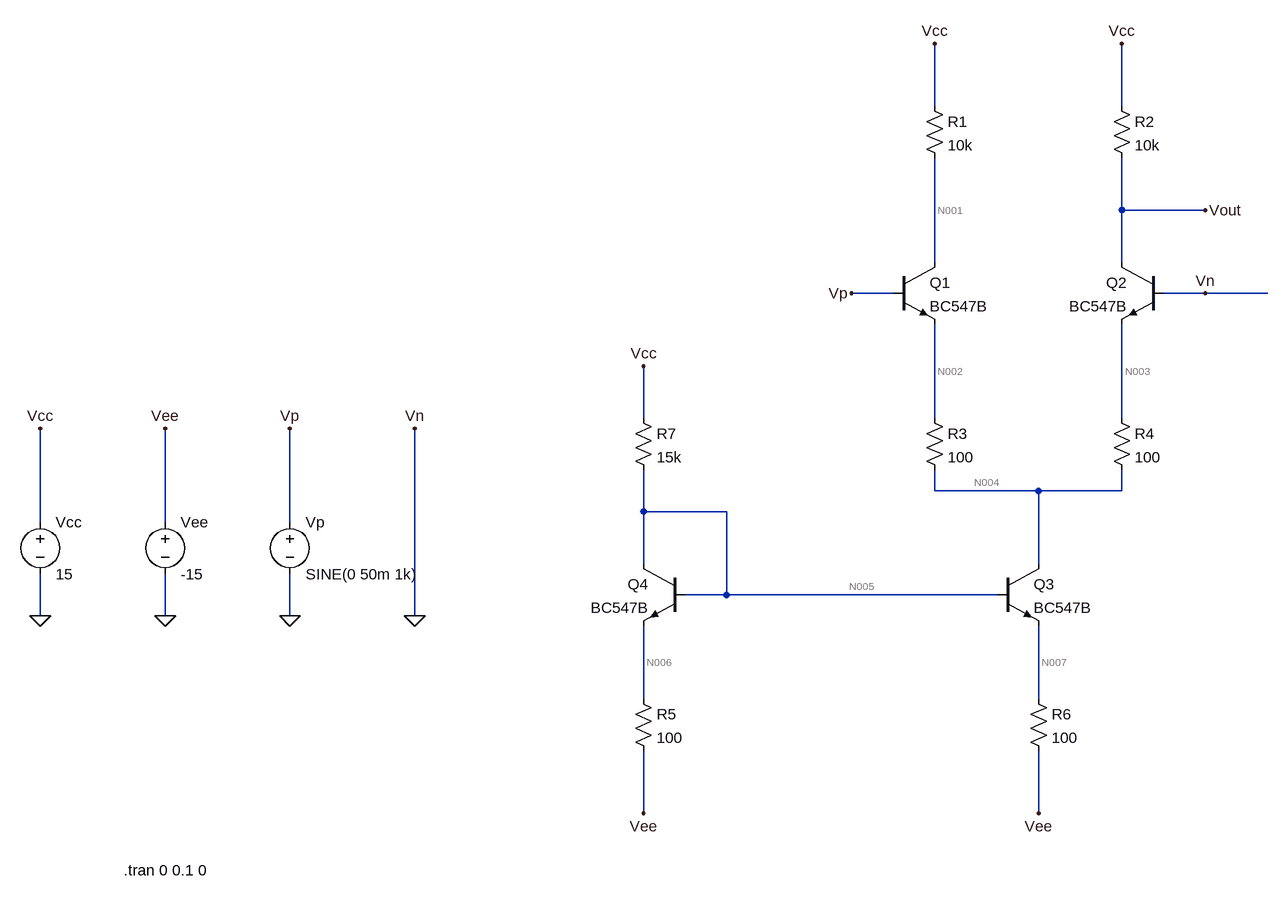
[diagram p0: schematic Draft3.asc]
Draft3.asc, the LTspice schematic file:
Version 4
SHEET 1 880 1244
WIRE 96 48 96 -48
WIRE 384 48 384 -48
WIRE 384 208 384 128
WIRE 512 208 384 208
WIRE 96 288 96 128
WIRE 384 288 384 208
WIRE 32 336 -32 336
WIRE 512 336 448 336
WIRE 608 336 512 336
WIRE -352 528 -352 448
WIRE 96 528 96 384
WIRE 384 528 384 384
WIRE 96 640 96 608
WIRE 256 640 96 640
WIRE 384 640 384 608
WIRE 384 640 256 640
WIRE -352 672 -352 608
WIRE -224 672 -352 672
WIRE -1280 688 -1280 544
WIRE -1088 688 -1088 544
WIRE -896 688 -896 544
WIRE -352 752 -352 672
WIRE 256 752 256 640
WIRE -224 800 -224 672
WIRE -224 800 -288 800
WIRE 192 800 -224 800
WIRE -1280 832 -1280 768
WIRE -1088 832 -1088 768
WIRE -896 832 -896 768
WIRE -704 832 -704 544
WIRE -352 960 -352 848
WIRE 256 960 256 848
WIRE -352 1136 -352 1040
WIRE 256 1136 256 1040
FLAG -352 448 Vcc
FLAG 96 -48 Vcc
FLAG 384 -48 Vcc
FLAG -352 1136 Vee
FLAG 256 1136 Vee
FLAG -32 336 Vp
FLAG 512 336 Vn
FLAG 512 208 Vout
FLAG -1280 832 0
FLAG -1088 832 0
FLAG -1280 544 Vcc
FLAG -1088 544 Vee
FLAG -896 832 0
FLAG -896 544 Vp
FLAG -704 832 0
FLAG -704 544 Vn
SYMBOL res 80 32 R0
SYMATTR InstName R1
SYMATTR Value 10k
SYMBOL res 368 32 R0
SYMATTR InstName R2
SYMATTR Value 10k
SYMBOL res 80 512 R0
SYMATTR InstName R3
SYMATTR Value 100
SYMBOL res 368 512 R0
SYMATTR InstName R4
SYMATTR Value 100
SYMBOL res -368 944 R0
SYMATTR InstName R5
SYMATTR Value 100
SYMBOL res 240 944 R0
SYMATTR InstName R6
SYMATTR Value 100
SYMBOL res -368 512 R0
SYMATTR InstName R7
SYMATTR Value 15k
SYMBOL npn 32 288 R0
SYMATTR InstName Q1
SYMATTR Value BC547B
SYMBOL npn 448 288 M0
SYMATTR InstName Q2
SYMATTR Value BC547B
SYMBOL npn 192 752 R0
SYMATTR InstName Q3
SYMATTR Value BC547B
SYMBOL npn -288 752 M0
SYMATTR InstName Q4
SYMATTR Value BC547B
SYMBOL voltage -1280 672 R0
WINDOW 123 0 0 Left 0
WINDOW 39 0 0 Left 0
SYMATTR InstName Vcc
SYMATTR Value 15
SYMBOL voltage -1088 672 R0
WINDOW 123 0 0 Left 0
WINDOW 39 0 0 Left 0
SYMATTR InstName Vee
SYMATTR Value -15
SYMBOL voltage -896 672 R0
WINDOW 123 0 0 Left 0
WINDOW 39 0 0 Left 0
SYMATTR InstName Vp
SYMATTR Value SINE(0 50m 1k)
TEXT -1152 1224 Left 2 !.tran 0 0.1 0

The netlist it stands for:
* Draft3.asc
R1 Vcc N001 10k
R2 Vcc Vout 10k
R3 N002 N004 100
R4 N003 N004 100
R5 N006 Vee 100
R6 N007 Vee 100
R7 Vcc N005 15k
Q1 N001 Vp N002 0 BC547B
Q2 Vout 0 N003 0 BC547B
Q3 N004 N005 N007 0 BC547B
Q4 N005 N005 N006 0 BC547B
Vcc Vcc 0 15
Vee Vee 0 -15
Vp Vp 0 SINE(0 50m 1k)
.model NPN NPN
.model PNP PNP
.lib standard.bjt
.tran 0 0.1 0
.backanno
.end

* Results of the author's LTspice run, read from the files saved beside the schematic
* Operating Point, zero values left out:
*   V(vcc) = 15 V
*   V(n001) = 5.146 V
*   V(vout) = 5.146 V
*   V(n002) = -636.5 mV
*   V(n004) = -735.3 mV
*   V(n003) = -636.5 mV
*   V(n006) = -14.81 V
*   V(vee) = -15 V
*   V(n007) = -14.8 V
*   V(n005) = -14.15 V
*   Ic(Q4) = 1.931 mA
*   Ib(Q4) = 6.879 µA
*   Ie(Q4) = -1.938 mA
*   Ic(Q3) = 1.977 mA
*   Ib(Q3) = 5.774 µA
*   Ie(Q3) = -1.983 mA
*   Ic(Q2) = 985.4 µA
*   Ib(Q2) = 3.22 µA
*   Ie(Q2) = -988.7 µA
*   Ic(Q1) = 985.4 µA
*   Ib(Q1) = 3.22 µA
*   Ie(Q1) = -988.7 µA
*   I(R7) = 1.943 mA
*   I(R6) = 1.983 mA
*   I(R5) = 1.938 mA
*   I(R4) = 988.7 µA
*   I(R3) = 988.7 µA
*   I(R2) = 985.4 µA
*   I(R1) = 985.4 µA
*   I(Vp) = -3.22 µA
*   I(Vee) = 3.921 mA
*   I(Vcc) = -3.914 mA
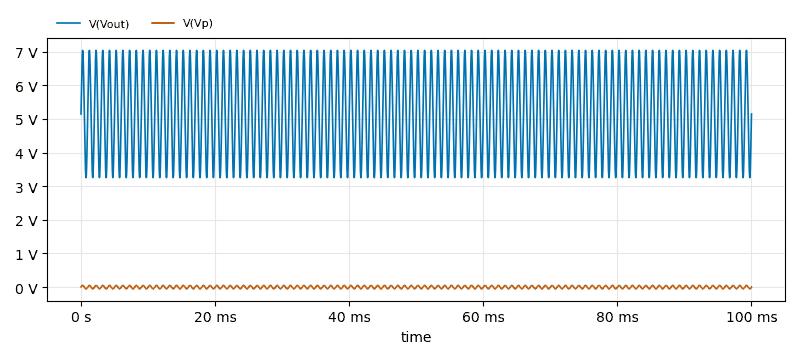
[diagram p1: Transient Analysis of Draft3.asc, plotted from the saved traces]
* Transient Analysis, 1 run:
*   V(Vout): min 3.255 V, max 7.037 V, average 5.146 V, rms 5.317 V, last 5.145 V
*   V(Vp): min -50 mV, max 50 mV, average 211.4 nV, rms 35.93 mV, last 0 V